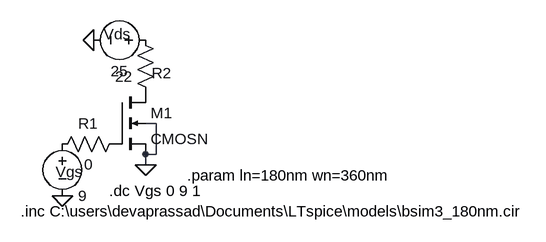
[diagram p0: schematic nmos_char.asc]
nmos_char.asc, the LTspice schematic file:
Version 4.1
SHEET 1 880 680
WIRE 176 144 160 144
WIRE 176 192 176 144
WIRE 176 192 160 192
WIRE 160 208 160 192
FLAG 160 208 0
FLAG 80 16 0
FLAG 32 256 0
SYMBOL nmos4 112 96 R0
SYMATTR InstName M1
SYMATTR Value2 l={ln} w={wn}
SYMATTR Value CMOSN
SYMBOL voltage 32 160 R0
WINDOW 0 -10 59 Left 2
WINDOW 123 0 0 Left 0
WINDOW 39 0 0 Left 0
SYMATTR InstName Vgs
SYMATTR Value 9
SYMBOL voltage 176 16 R90
WINDOW 0 6 60 VBottom 2
WINDOW 3 32 56 VTop 2
WINDOW 123 0 0 Left 0
WINDOW 39 0 0 Left 0
SYMATTR InstName Vds
SYMATTR Value 25
SYMBOL res 128 160 R90
WINDOW 0 0 56 VBottom 2
WINDOW 3 32 56 VTop 2
SYMATTR InstName R1
SYMATTR Value 0
SYMBOL res 176 112 R180
WINDOW 0 -24 45 Left 2
WINDOW 3 36 40 Left 2
SYMATTR InstName R2
SYMATTR Value 22
TEXT 104 248 Left 2 !.dc Vgs 0 9 1
TEXT -32 280 Left 2 !.inc C:\\users\\devaprassad\\Documents\\LTspice\\models\\bsim3_180nm.cir
TEXT 224 224 Left 2 !.param ln=180nm wn=360nm

The netlist it stands for:
* nmos_char.asc
M1 P001 P002 0 0 CMOSN l={ln} w={wn}
Vgs P003 0 9
Vds P004 0 25
R1 P002 P003 0
R2 P001 P004 22
.model NMOS NMOS
.model PMOS PMOS
.lib standard.mos
.dc Vgs 0 9 1
.inc C:\users\devaprassad\Documents\LTspice\models\bsim3_180nm.cir
.param ln=180nm wn=360nm
.backanno
.end